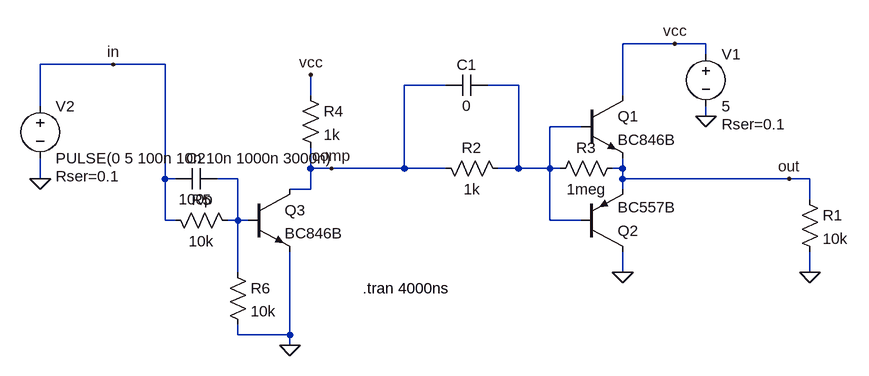
[diagram p0: schematic pull_push.asc]
pull_push.asc, the LTspice schematic file:
Version 4
SHEET 1 880 680
WIRE 224 -16 144 -16
WIRE 272 -16 224 -16
WIRE 272 0 272 -16
WIRE -640 16 -752 16
WIRE -560 16 -640 16
WIRE -128 48 -192 48
WIRE -16 48 -64 48
WIRE -336 64 -336 32
WIRE 144 64 144 -16
WIRE -752 80 -752 16
WIRE 272 96 272 80
WIRE 80 112 32 112
WIRE -336 176 -336 144
WIRE -304 176 -336 176
WIRE -192 176 -192 48
WIRE -192 176 -304 176
WIRE -128 176 -192 176
WIRE -16 176 -16 48
WIRE -16 176 -48 176
WIRE 32 176 32 112
WIRE 32 176 -16 176
WIRE 48 176 32 176
WIRE 144 176 144 160
WIRE 144 176 128 176
WIRE -752 192 -752 160
WIRE -560 192 -560 16
WIRE -544 192 -560 192
WIRE -448 192 -480 192
WIRE 144 192 144 176
WIRE 400 192 144 192
WIRE 432 192 400 192
WIRE -336 208 -336 176
WIRE -336 208 -368 208
WIRE 144 208 144 192
WIRE 432 224 432 192
WIRE -560 256 -560 192
WIRE -544 256 -560 256
WIRE -448 256 -448 192
WIRE -448 256 -464 256
WIRE -432 256 -448 256
WIRE 32 256 32 176
WIRE 80 256 32 256
WIRE -448 336 -448 256
WIRE 144 336 144 304
WIRE 432 336 432 304
WIRE -448 432 -448 416
WIRE -368 432 -368 304
WIRE -368 432 -448 432
WIRE -368 448 -368 432
FLAG 144 336 0
FLAG 272 96 0
FLAG 400 192 out
FLAG -752 192 0
FLAG 432 336 0
FLAG 224 -16 vcc
FLAG -336 32 vcc
FLAG -368 448 0
FLAG -640 16 in
FLAG -304 176 comp
SYMBOL npn 80 64 R0
SYMATTR InstName Q1
SYMATTR Value BC846B
SYMBOL pnp 80 304 M180
SYMATTR InstName Q2
SYMATTR Value BC557B
SYMBOL voltage 272 -16 R0
WINDOW 123 0 0 Left 2
WINDOW 39 24 124 Left 2
SYMATTR SpiceLine Rser=0.1
SYMATTR InstName V1
SYMATTR Value 5
SYMBOL voltage -752 64 R0
WINDOW 123 0 0 Left 2
WINDOW 39 24 124 Left 2
SYMATTR SpiceLine Rser=0.1
SYMATTR InstName V2
SYMATTR Value PULSE(0 5 100n 10n 10n 1000n 3000n)
SYMBOL res -144 160 M90
WINDOW 0 0 56 VBottom 2
WINDOW 3 32 56 VTop 2
SYMATTR InstName R2
SYMATTR Value 1k
SYMBOL cap -64 32 R90
WINDOW 0 0 32 VBottom 2
WINDOW 3 32 32 VTop 2
SYMATTR InstName C1
SYMATTR Value 0
SYMBOL res 416 208 R0
SYMATTR InstName R1
SYMATTR Value 10k
SYMBOL res 144 160 R90
WINDOW 0 0 56 VBottom 2
WINDOW 3 32 56 VTop 2
SYMATTR InstName R3
SYMATTR Value 1meg
SYMBOL npn -432 208 R0
SYMATTR InstName Q3
SYMATTR Value BC846B
SYMBOL res -352 48 R0
SYMATTR InstName R4
SYMATTR Value 1k
SYMBOL res -560 240 M90
WINDOW 0 0 56 VBottom 2
WINDOW 3 32 56 VTop 2
SYMATTR InstName R5
SYMATTR Value 10k
SYMBOL res -464 320 R0
SYMATTR InstName R6
SYMATTR Value 10k
SYMBOL cap -480 176 R90
WINDOW 0 0 32 VBottom 2
WINDOW 3 32 32 VTop 2
SYMATTR InstName C2
SYMATTR Value 100p
TEXT -256 360 Left 2 !.tran 4000ns

The netlist it stands for:
* pull_push.asc
Q1 vcc N001 out 0 BC846B
Q2 0 N001 out 0 BC557B
V1 vcc 0 5 Rser=0.1
V2 in 0 PULSE(0 5 100n 10n 10n 1000n 3000n) Rser=0.1
R2 comp N001 1k
C1 N001 comp 0
R1 out 0 10k
R3 out N001 1meg
Q3 comp N002 0 0 BC846B
R4 vcc comp 1k
R5 in N002 10k
R6 N002 0 10k
C2 N002 in 100p
.model NPN NPN
.model PNP PNP
.lib standard.bjt
.tran 4000ns
.backanno
.end